# EAGLE design nfc-card (EAGLE 9.7.0)
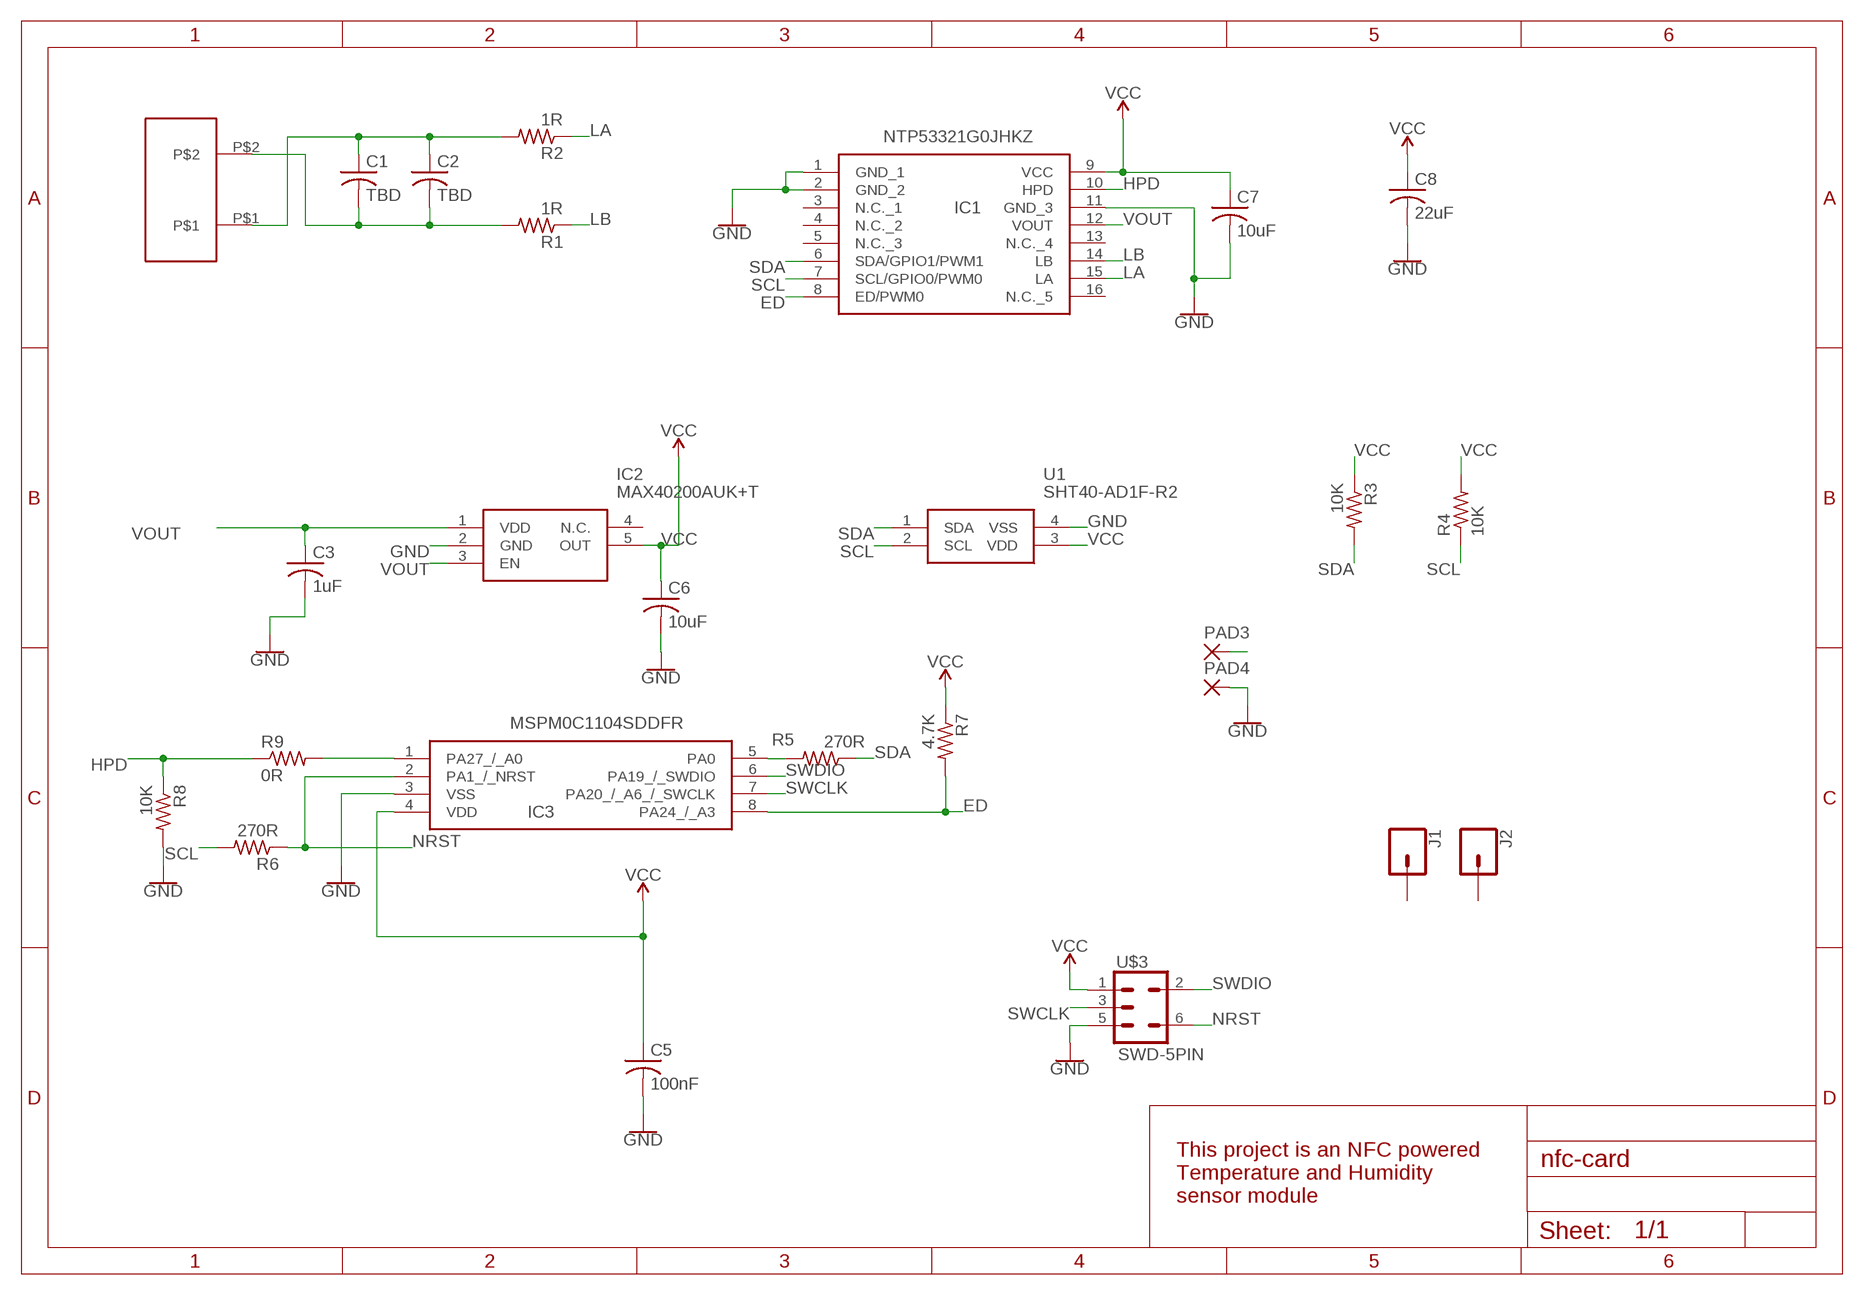
[diagram p0: schematic, sheet 1]

## Parts
C1  TBD  C-USC0402  [C0402]
C2  TBD  C-USC0402  [C0402]
C3  1uF  C-USC0805  [C0805]
C5  100nF  C-USC0402  [C0402]
C6  10uF  C-USC0402  [C0402]
C7  10uF  C-USC0805  [C0805]
C8  22uF  C-USC1206  [C1206]
IC1  NTP53321G0JHKZ  [NTP53321G0JHKZ]
IC2  MAX40200AUK+T  [SOT95P280X145-5N]
IC3  MSPM0C1104SDDFR  [SOT65P280X110-8N]
J1  CONN_01PTH_2MM  [1X01_2MM]
J2  CONN_01PTH_2MM  [1X01_2MM]
PAD3  1,6/0,8  [1,6/0,8]
PAD4  1,6/0,8  [1,6/0,8]
R1  1R  R-US_R0402  [R0402]
R2  1R  R-US_R0402  [R0402]
R3  10K  R-US_R0402  [R0402]
R4  10K  R-US_R0402  [R0402]
R5  270R  R-US_R0402  [R0402]
R6  270R  R-US_R0402  [R0402]
R7  4.7K  R-US_R0402  [R0402]
R8  10K  R-US_R0402  [R0402]
R9  0R  R-US_R0402  [R0402]
U1  SHT40-AD1F-R2  [SHT40AD1FR2]
U$2  NFC-POWER  [NFC-POWER]
U$3  SWD-5PIN  [PAD_05_03X2_TP_NO4]

## Nets
ED: IC1.8(ED/PWM0) IC3.8(PA24_/_A3) R7.2
GND: C3.2 C5.2 C6.2 C7.2 C8.2 IC1.1(GND_1) IC1.2(GND_2) IC1.11(GND_3) IC2.2(GND) IC3.3(VSS) PAD4.1(P) R8.2 U1.4(VSS) U$3.5
HPD: IC1.10(HPD) R8.1 R9.1
LA: IC1.15(LA) R2.1
LB: IC1.14(LB) R1.1
N$1: IC3.5(PA0) R5.2
N$2: IC3.1(PA27_/_A0) R9.2
N$24: C1.2 C2.2 R1.2 U$2.P$2
N$25: C1.1 C2.1 R2.2 U$2.P$1
NRST: IC3.2(PA1_/_NRST) R6.1 U$3.6
SCL: IC1.7(SCL/GPIO0/PWM0) R4.1 R6.2 U1.2(SCL)
SDA: IC1.6(SDA/GPIO1/PWM1) R3.2 R5.1 U1.1(SDA)
SWCLK: IC3.7(PA20_/_A6_/_SWCLK) U$3.3
SWDIO: IC3.6(PA19_/_SWDIO) U$3.2
VCC: C5.1 C6.1 C7.1 C8.1 IC1.9(VCC) IC2.5(OUT) IC3.4(VDD) R3.1 R4.2 R7.1 U1.3(VDD) U$3.1
VOUT: C3.1 IC1.12(VOUT) IC2.1(VDD) IC2.3(EN) PAD3.1(P)
Unconnected: IC1.3(N.C._1) IC1.4(N.C._2) IC1.5(N.C._3) IC1.13(N.C._4) IC1.16(N.C._5) IC2.4(N.C.) J1.1 J2.1

## Notes on the sheet
- This project is an NFC powered 
  Temperature and Humidity 
  sensor module

## Library data of the parts
C1-C3 C5-C8 = adafruit:C-US: CAPACITOR, American symbol
IC1 = NTP53321G0JHKZ:NTP53321G0JHKZ: Interface - Specialized NTAG Source: Datasheet <https://www.nxp.com/docs/en/data-sheet/NTP53x2.pdf>; ARROW_PART_NUMBER: NTP53321G0JHKZ; ARROW_PRICE-STOCK: https://www.arrow.com/en/products/ntp53321g0jhkz/nxp-semiconductors?region=nac; DESCRIPTION: Interface - Specialized NTAG; HEIGHT: 0.5mm; MANUFACTURER_NAME: NXP; MANUFACTURER_PART_NUMBER: NTP53321G0JHKZ; MOUSER_PART_NUMBER: 771-NTP53321G0JHKZ; MOUSER_PRICE-STOCK: https://www.mouser.co.uk/ProductDetail/NXP-Semiconductors/NTP53321G0JHKZ?qs=u16ybLDytRYy2Rt%2Fib73Dw%3D%3D
IC2 = MAX40200AUK+T:MAX40200AUK+T: Ultra-Tiny Micropower, 1A Ideal Diode with Ultra-Low Voltage Drop Source: Datasheet <https://www.analog.com/MAX40200/datasheet>; ARROW_PART_NUMBER: MAX40200AUK+T; ARROW_PRICE-STOCK: https://www.arrow.com/en/products/max40200aukt/analog-devices.html?utm_currency=USD&region=asia; DESCRIPTION: Ultra-Tiny Micropower, 1A Ideal Diode with Ultra-Low Voltage Drop; HEIGHT: 1.45mm; MANUFACTURER_NAME: Analog Devices; MANUFACTURER_PART_NUMBER: MAX40200AUK+T; MOUSER_PART_NUMBER: 700-MAX40200AUK+T; MOUSER_PRICE-STOCK: https://www.mouser.co.uk/ProductDetail/Analog-Devices-Maxim-Integrated/MAX40200AUK%2bT?qs=5aG0NVq1C4yORXmgClGWGQ%3D%3D
IC3 = MSPM0C1104SDDFR:MSPM0C1104SDDFR: ARM Microcontrollers - MCU 24MHz Arm Cortex-M0+ MCU with 16KB flash Source: Datasheet <https://www.ti.com/lit/ds/symlink/mspm0c1104.pdf?ts=1779039838940&ref_url=https%3A%2F%2Fwww.ti.com%2Fproduct%2FMSPM0C1104%2Fpart-details%2FMSPM0C1104SRUKR>; DESCRIPTION: ARM Microcontrollers - MCU 24MHz Arm Cortex-M0+ MCU with 16KB flash; HEIGHT: 1.1mm; MANUFACTURER_NAME: Texas Instruments; MANUFACTURER_PART_NUMBER: MSPM0C1104SDDFR; MOUSER_PART_NUMBER: 595-MSPM0C1104SDDFR; MOUSER_PRICE-STOCK: https://www.mouser.co.uk/ProductDetail/Texas-Instruments/MSPM0C1104SDDFR?qs=dbcCsuKDzFV0JvqjQIWgGw%3D%3D
J1 J2 = SparkFun-Connectors:CONN_01: Single connection point. Often used as Generic Header-pin footprint for 0.1 inch spaced/style header connections On any of the 0.1 inch spaced packages, you can populate with these: Break Away Headers - Straight <https://www.sparkfun.com/products/116> (PRT-00116) Break Away Male Headers - Right Angle <https://www.sparkfun.com/products/553> (PRT-00553) Female Headers <https://www.sparkfun.com/products/115> (PRT-00115) Break Away Headers - Machine Pin <https://www.sparkfun.com/products/117> (PRT-00117) Break Away Female Headers - Swiss Machine Pin <https://www.sparkfun.com/products/743> (PRT-00743) This device is also useful as a general connection point to wire up your design to another part of your project. Our various solder wires solder well into these plated through hole pads. Hook-Up Wire - Assortment (Stranded, 22 AWG) <https://www.sparkfun.com/products/11375> (PRT-11375) Hook-Up Wire - Assortment (Solid Core, 22 AWG) <https://www.sparkfun.com/products/11367> (PRT-11367) View the entire wire category on our website here <https://www.sparkfun.com/categories/141> Special notes: SMTSO-256-ET is a "flush mount" nut for a 4-40 screw. We mostly use this on specialty testbeds; it is a nice way to connect hardware to your PCB at an adjustable hieght. Also note, the SNAP packages are for using a snappable style connector. We sell a baggie of snaps and they are also used on two LilyPad designs: Snap Assortment - 30 pack (male and female) <https://www.sparkfun.com/products/11347> (DEV-11347) LilyPad Arduino SimpleSnap <https://www.sparkfun.com/products/10941> (DEV-10941) LilyPad SimpleSnap Protoboard <https://www.sparkfun.com/products/10940> (DEV-10940)
PAD3 PAD4 = wirepad:1,6/0,8: THROUGH-HOLE PAD
R1-R9 = adafruit:R-US_: RESISTOR, American symbol
U1 = SHT40-AD1F-R2:SHT40-AD1F-R2: Board Mount Humidity Sensors Digital Humidity and Temperature Sensor incl Filter Membrane Source: Datasheet <https://sensirion.com/media/documents/33FD6951/63E1087C/Datasheet_SHT4x_1.pdf>; ARROW_PART_NUMBER: SHT40-AD1F-R2; ARROW_PRICE-STOCK: https://www.arrow.com/en/products/sht40-ad1f-r2/sensirion-ag?region=nac; DESCRIPTION: Board Mount Humidity Sensors Digital Humidity and Temperature Sensor incl Filter Membrane; HEIGHT: 0.59mm; MANUFACTURER_NAME: Sensirion; MANUFACTURER_PART_NUMBER: SHT40-AD1F-R2; MOUSER_PART_NUMBER: 403-SHT40-AD1F-R2; MOUSER_PRICE-STOCK: https://www.mouser.co.uk/ProductDetail/Sensirion/SHT40-AD1F-R2?qs=rQFj71Wb1eVPr6MxV5k7AQ%3D%3D
U$2 = Tanmoy-Lib:NFC-POWER
U$3 = SparkFun-Connectors:SWD-5PIN: 5-pin SWD connector Test-point based header for SWD. Pin 1 - PWR Pin 2 - SWDIO Pin 3 - SWCLK Pin 4 - NC Pin 5 - GND Pin 6 - RESET

## Board
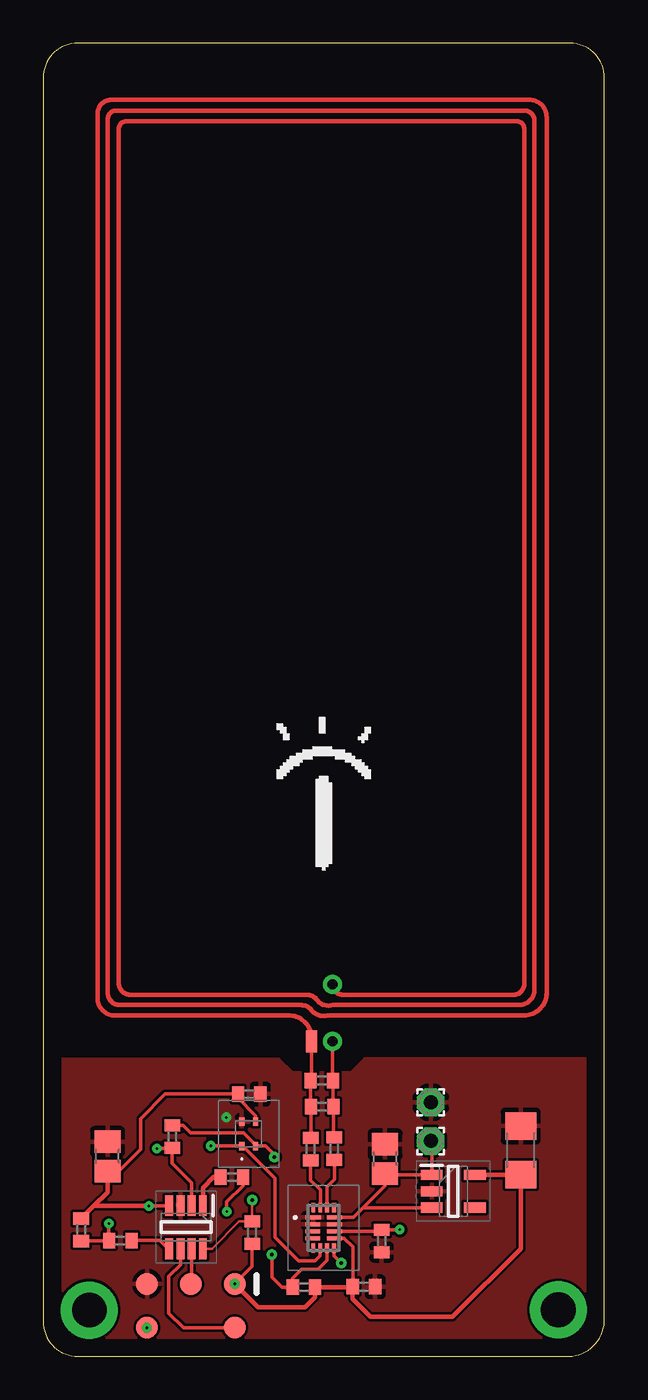
[diagram p1: board, top side]
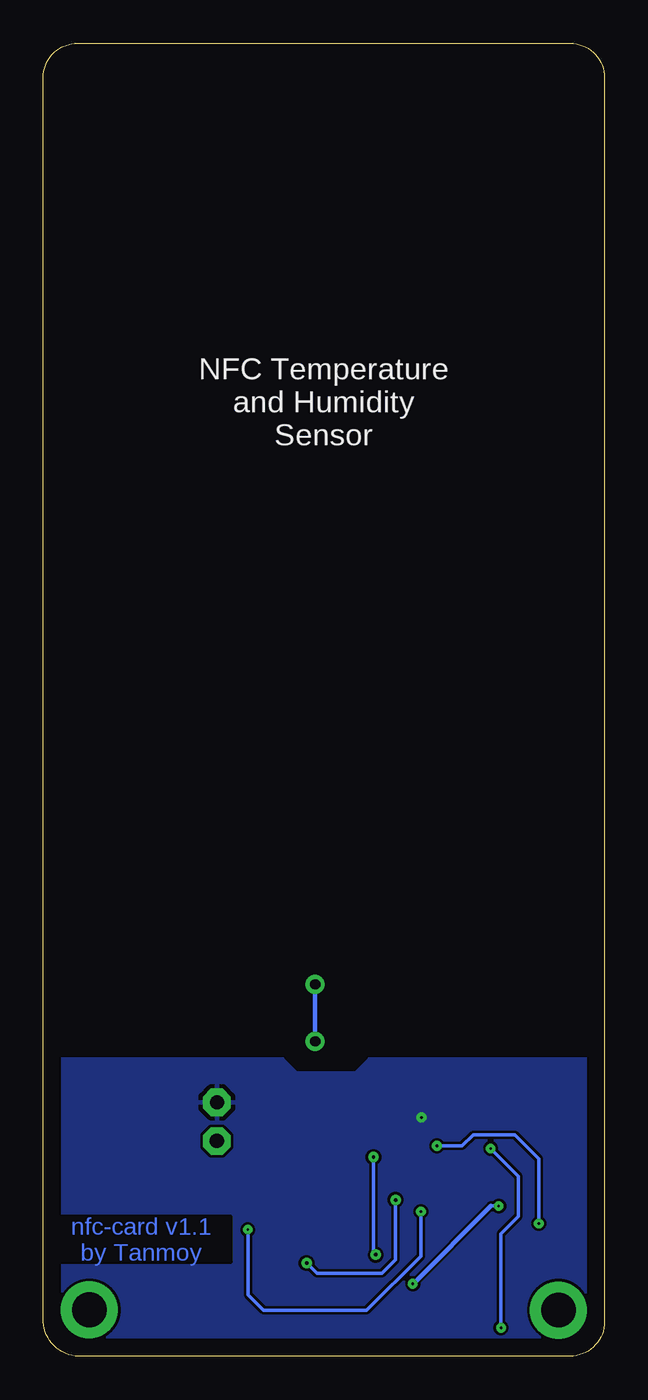
[diagram p2: board, bottom side, seen from below]

Size 32.5 x 76 mm. Coordinates in mm from the lower left corner, seen from the top.
Outline: 32.5,2 32.5,74 arc90 30.5,76 2,76 arc90 0,74 0,2 arc90 2,0 30.25,0 arc90 32.5,2
Copper layers (1*16): Top 0.035mm / dielectric 1.5mm / Bottom 0.035mm
Design rules "Fusion Electronics Design Rules *": minimum track width 6mil, minimum drill 0.15mm, track to track 6mil, track to pad 6mil, pad to pad 6mil, via to via 6mil, smd to smd 6mil, copper to edge 40mil, drill to drill 6mil, minimum pad ring 10mil, minimum via ring 8mil, stop-mask expansion 4mil, vias tented up to drill 9999mil, thermal gap 10mil

### Footprints (pad centres in the part's own frame; a part is rotated, then mirrored left to right if it is on the bottom)
C0402 = smd 0.7 x 0.9: 1 -0.65,0; 2 0.65,0
C0805 = smd 1.3 x 1.5: 1 -0.85,0; 2 0.85,0
C1206 = smd 1.6 x 1.8: 1 -1.4,0; 2 1.4,0
NTP53321G0JHKZ = smd 0.9 x 0.22: 1 -0.6,0.6 | smd 0.85 x 0.22: 2 -0.625,0.2; 3 -0.625,-0.2; 4 -0.625,-0.6; 9 0.625,-0.6; 10 0.625,-0.2; 11 0.625,0.2; 12 0.625,0.6 | smd 0.22 x 0.55: 5 -0.6,-1.175; 6 -0.2,-1.175; 7 0.2,-1.175; 8 0.6,-1.175; 13 0.6,1.175; 14 0.2,1.175; 15 -0.2,1.175; 16 -0.6,1.175
SOT95P280X145-5N = smd 1.25 x 0.6: 1 -1.25,0.95; 2 -1.25,0; 3 -1.25,-0.95; 4 1.25,-0.95; 5 1.25,0.95
SOT65P280X110-8N = smd 1.2 x 0.45: 1 -1.25,0.975; 2 -1.25,0.325; 3 -1.25,-0.325; 4 -1.25,-0.975; 5 1.25,-0.975; 6 1.25,-0.325; 7 1.25,0.325; 8 1.25,0.975
1X01_2MM = drill 2 pad 3.302: 1 0,0
1,6/0,8 = drill 0.813 pad 1.6 octagon: 1 0,0
R0402 = smd 0.7 x 0.9: 1 -0.65,0; 2 0.65,0
SHT40AD1FR2 = smd 0.5 x 0.3: 1 -0.7,0.4; 2 -0.7,-0.4; 3 0.7,-0.4; 4 0.7,0.4
NFC-POWER = smd 0.635 x 1.27: P$1 -0.6,-1.5 | drill 0.6: P$2 0.6,-1.5; P$3 0.6,1.8
PAD_05_03X2_TP_NO4 = smd 1.27 x 1.27: 1 -2.54,-1.27; 2 -2.54,1.27; 3 0,-1.27; 5 2.54,-1.27; 6 2.54,1.27

### Placement (x,y rotation side)
C1  16.13,15.97 0 top
C2  16.15,14.45 0 top
C3  19.8,11.43 90 top
C5  11.93,15.18 0 top
C6  18.57,4.03 0 top
C7  3.73,11.58 90 top
C8  27.65,11.93 90 top
IC1  16.24,7.44 0 top
IC2  23.75,9.55 0 top
IC3  8.28,7.48 270 top
J1  2.67,2.67 0 top
J2  29.83,2.69 0 top
PAD3  22.44,12.47 0 top
PAD4  22.44,14.7 0 top
R1  16.86,12.01 90 top
R2  15.48,12 90 top
R3  2.2,7.32 270 top
R4  15.1,4 0 top
R5  4.47,6.7 0 top
R6  7.47,12.73 90 top
R7  12.1,7.15 90 top
R8  19.6,6.68 270 top
R9  10.93,10.38 180 top
U1  11.9,12.88 90 top
U$2  16.15,19.73 0 top
U$3  8.55,2.92 180 top

### Tracks (layer width: path | path; a pad name or v marks a point on that pad's centre or on a via)
ED  (via drill 0.2)
  Top 0.152: IC3.8 9.78,6.23 11.35,7.8 R7.2 v12.1,9.05
  Top 0.2: IC1.8 16.84,5.81 v17.25,5.4
  Bottom 0.2: v17.25,5.4 16.65,4.8 12.88,4.8 12.1,5.58 v12.1,9.05
GND  (via drill 0.15)
  other vias: 10.6,13.83
  pour Top: 17.79,16.44 17.77,16.43 14.48,16.43 14.46,16.44 13.67,17.23 0.58,17.23 0.58,2.51 0.6,2.2 0.67,1.91 0.79,1.63 0.94,1.37 1.14,1.14 1.37,0.95 1.63,0.79 1.91,0.67 2.2,0.6 2.5,0.58 30,0.58 30.3,0.6 30.59,0.67 30.87,0.79 31.13,0.95 31.36,1.14 31.56,1.37 31.71,1.63 31.83,1.91 31.9,2.2 31.92,2.51 31.92,17.25 18.61,17.25
  pour Bottom: 17.79,16.44 17.77,16.43 14.48,16.43 14.46,16.44 13.64,17.25 0.58,17.25 0.58,2.51 0.6,2.2 0.67,1.91 0.79,1.63 0.94,1.37 1.14,1.14 1.37,0.95 1.63,0.79 1.91,0.67 2.2,0.6 2.5,0.58 30,0.58 30.3,0.6 30.59,0.67 30.87,0.79 31.13,0.95 31.36,1.14 31.56,1.37 31.71,1.63 31.83,1.91 31.9,2.2 31.92,2.51 31.92,17.25 18.61,17.25
HPD  (via drill 0.15)
  Top 0.2: IC1.10 19.51,7.24 R8.1 v20.65,7.33 | v10.62,8.38 10.62,8.93 11.57,9.88 R9.1
  Bottom 0.2: v20.65,7.33 20.65,3.55 19.75,2.65 13.78,2.65 10.62,5.8 v10.62,8.38
LA
  Top 0.2: R2.1 15.48,10.19 16.05,9.63 IC1.15
LB
  Top 0.2: R1.1 16.86,10.24 16.44,9.82 IC1.14
N$1
  Top 0.2: IC3.5 7.22,6.23 6.75,6.7 R5.2
N$2
  Top 0.254: IC3.1 9.25,9.75 9.88,10.38 R9.2
N$24
  Top 0.2: R1.2 16.8,12.72 C2.2 16.78,14.47 C1.2 16.75,16 U$2.P$2
N$25
  Top 0.2: 15.5,15.99 C1.1 15.48,14.47 C2.1 15.5,12.66 R2.2 | U$2.P$1 15.55,16.04
  Top 0.254: 15.55,16.04 15.5,15.99
NRST  (via drill 0.15)
  Top 0.2: IC3.2 8.6,10.05 7.47,11.18 R6.1 7.42,12.03 v6.59,12.03 | U$3.6 v5.99,1.65
  Bottom 0.2: v6.59,12.03 4.97,10.41 4.97,8.1 5.99,7.08 v5.99,1.65
SCL  (via drill 0.2)
  Top 0.2: IC1.7 16.44,5.54 15.93,5.03 14.95,5.03 14.45,4.53 R4.1 13.82,4 13.25,4.58 v13.25,5.88 | R6.2 8.1,13.38 8.55,12.93 11.61,12.93 12.3,12.23 U1.2 12.88,12.18 13.38,11.68 v13.38,11.53
  Bottom 0.2: v13.38,11.53 13.38,6 v13.25,5.88
SDA  (via drill 0.15)
  Top 0.2: R3.2 3.79,6.67 3.8,6.68 | U1.1 v9.71,12.18 v9.7,12.18 11.54,12.18 13.43,10.3 13.43,6.88 14.78,5.53 15.75,5.53 16.04,5.82 IC1.6 | v3.8,7.68 3.8,6.68 | R5.1 3.8,6.68
  Bottom 0.2: v3.8,7.68 3.8,11.43 5.2,12.83 7.6,12.83 8.24,12.18 v9.7,12.18
SWCLK
  Top 0.2: IC3.7 8.6,4.24 U$3.3
SWDIO
  Top 0.2: IC3.6 7.95,5.3 7.28,4.63 7.28,2.5 8.12,1.65 U$3.2
VCC  (via drill 0.15)
  Top 0.2: IC1.9 17.41,6.84 17.93,6.33 C6.1 17.9,4 | C5.1 11.5,14.95 | R7.1 12.1,5.2 U$3.1 v11.1,4.19 v11.1,4.2 | IC3.4 7.27,8.7 v6.12,8.7 | C7.1 4.4,10.73 5.65,11.98 5.65,13.75 7.08,15.18 C5.1 | C5.1 11.28,14.95 12.3,13.93 U1.3
  Top 0.254: U$3.1 12.46,2.83 15.18,2.83 15.75,3.4 R4.2 17.9,4 17.9,3.33 18.95,2.28 23.7,2.28 27.65,6.23 C8.1 27.63,10.5 IC2.5 | R3.1 2.92,8.7 | v6.12,8.7 2.92,8.7 | C7.1 3.73,9.5 2.92,8.7
  Bottom 0.2: 6.58,8.7 v6.12,8.7 | v11.1,4.2 11.07,4.2
  Bottom 0.254: 11.07,4.2 6.58,8.7
VOUT
  Top 0.2: IC1.12 17.96,8.04 18.52,8.6 | 18.52,8.6 IC2.3 | 18.52,8.6 19.8,9.88 C3.1 19.88,10.5 IC2.1 22.5,12.41 PAD3.1

### Text on the board
Bottom: nfc-card v1.1 / by Tanmoy
bPlace: NFC Temperature / and Humidity / Sensor